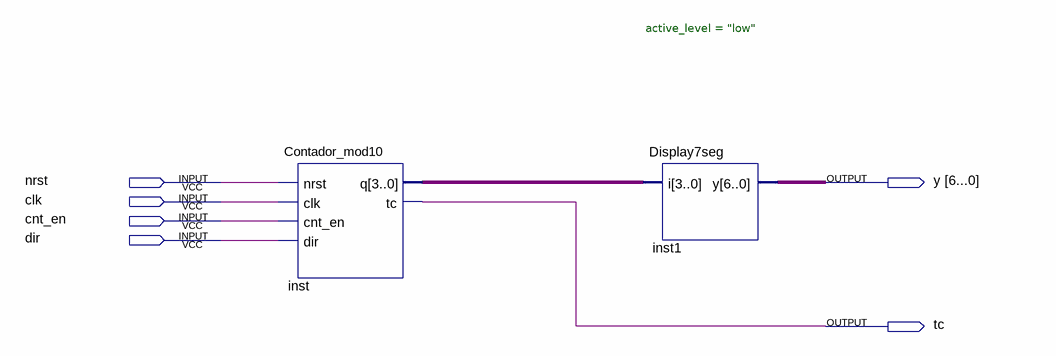
[diagram p0: schematic sheet]
// Quartus schematic Exercicio 1.bdf as structural Verilog: 2 symbols, 6 pins
module \Exercicio_1  (
  input  nrst,
  input  clk,
  input  cnt_en,
  input  dir,
  output \y_[6...0] ,
  output tc
);

  wire [3:0] inst_q;
  wire [6:0] inst1_y;

  Contador_mod10 inst (.nrst(nrst), .clk(clk), .cnt_en(cnt_en), .dir(dir), .q(inst_q), .tc(tc));
  Display7seg #(.active_level("low")) inst1 (.i(inst_q), .y(inst1_y));
endmodule
